# Altium schematic sheet Inputs_Outputs.SchDoc
size A4; Date: *******; ApprovedBy: *******; CheckedBy: None; Author: *******; CompanyName: *******; DrawnBy: Name; Engineer: *******; Organization: *******; Address1: *******; Address2: *******; Address3: *******; Address4: *******; DocumentNumber: Doc Num; Revision: *******; SheetNumber: 2; SheetTotal: 7; CurrentTime: *******; CurrentDate: *******; Time: *******; DocumentFullPathAndName: *******; DocumentName: *******; ModifiedDate: *******; ImagePath: *******; ProjectName: *******; Application_BuildNumber: *******
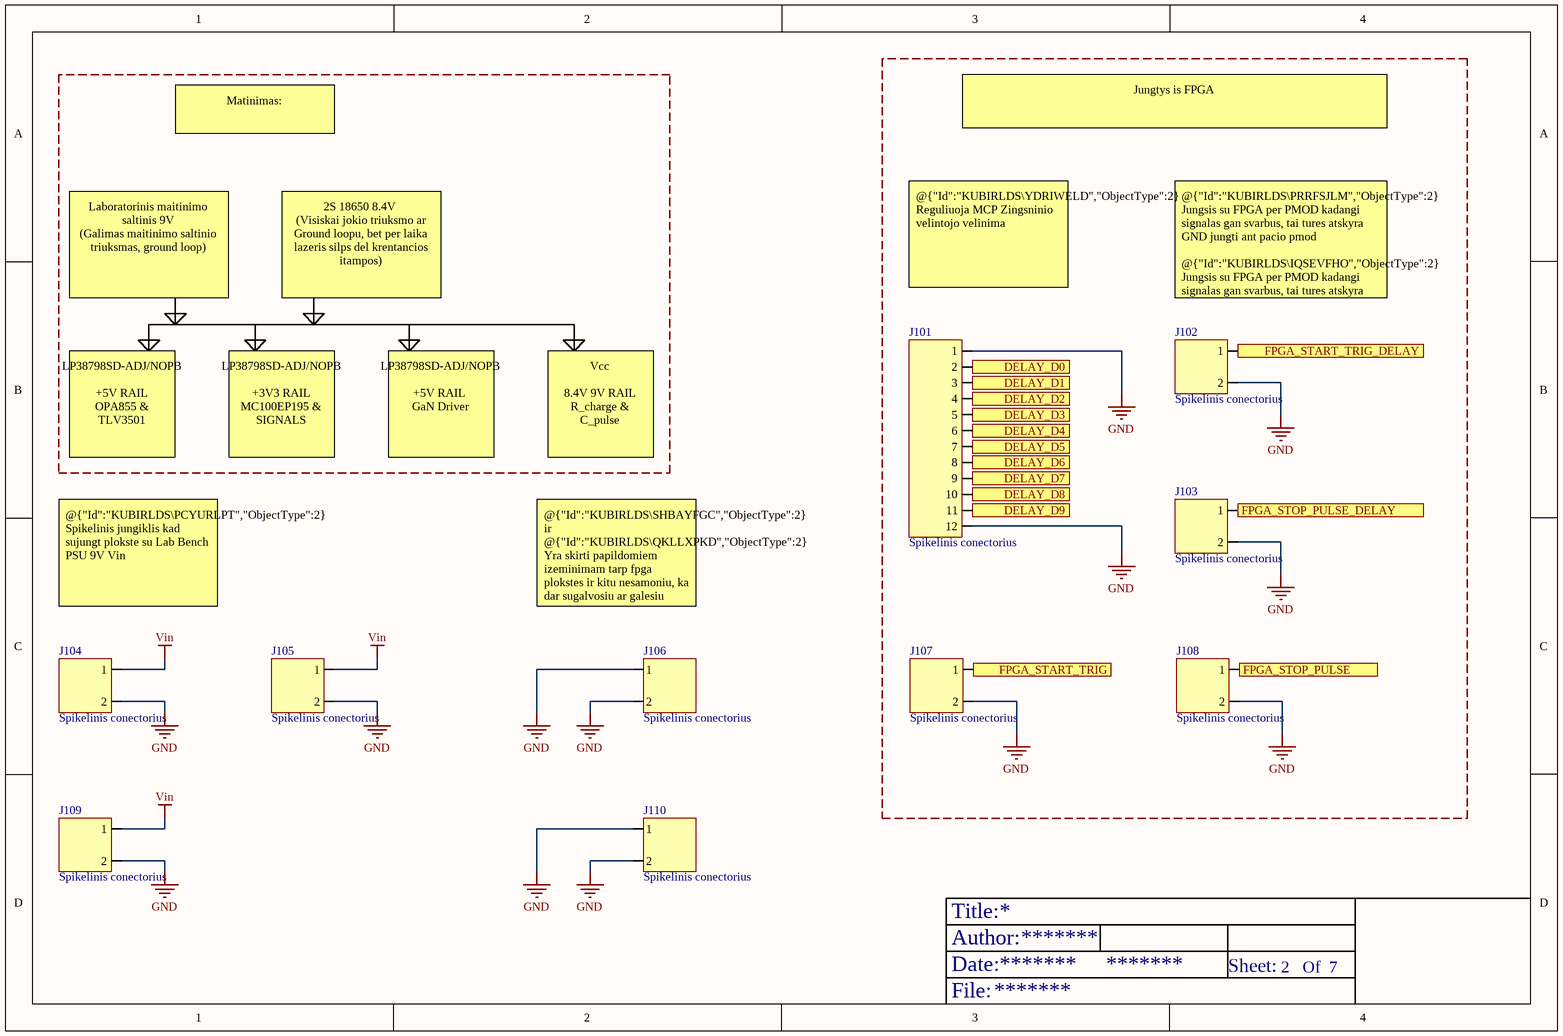
[diagram p0: Inputs_Outputs.SchDoc]

## Parts
J101  Spikelinis conectorius  [12pin header strip]
J102  Spikelinis conectorius  [2Pin header strip]
J103  Spikelinis conectorius  [2Pin header strip]
J104  Spikelinis conectorius  [2Pin header strip]
J105  Spikelinis conectorius  [2Pin header strip]
J106  Spikelinis conectorius  [2Pin header strip]
J107  Spikelinis conectorius  [2Pin header strip]
J108  Spikelinis conectorius  [2Pin header strip]
J109  Spikelinis conectorius  [2Pin header strip]
J110  Spikelinis conectorius  [2Pin header strip]

## Ports
DELAY_D0 (see Time_Delay[2B]), DELAY_D1 (see Time_Delay[2B]), DELAY_D2 (see Time_Delay[2B]), DELAY_D3 (see Time_Delay[2C]), DELAY_D4 (see Time_Delay[2C]), DELAY_D5 (see Time_Delay[2C]), DELAY_D6 (see Time_Delay[2C]), DELAY_D7 (see Time_Delay[2C]), DELAY_D8 (see Time_Delay[2C]), DELAY_D9 (see Time_Delay[2C]), FPGA_START_TRIG (see Laser_Driver[1C]), FPGA_START_TRIG_DELAY (see Time_Delay[1B]), FPGA_STOP_PULSE (see Light_Detection[4C]), FPGA_STOP_PULSE_DELAY (see Light_Detection[4B])

## Nets
GND: J101.1 J101.12 J102.2 J103.2 J104.2 J105.2 J106.1 J106.2 J107.2 J108.2 J109.2 J110.1 J110.2
Vin: J104.1 J105.1 J109.1
DELAY_D0: J101.2 ; port DELAY_D0
DELAY_D1: J101.3 ; port DELAY_D1
DELAY_D2: J101.4 ; port DELAY_D2
DELAY_D3: J101.5 ; port DELAY_D3
DELAY_D4: J101.6 ; port DELAY_D4
DELAY_D5: J101.7 ; port DELAY_D5
DELAY_D6: J101.8 ; port DELAY_D6
DELAY_D7: J101.9 ; port DELAY_D7
DELAY_D8: J101.10 ; port DELAY_D8
DELAY_D9: J101.11 ; port DELAY_D9
FPGA_START_TRIG: J107.1 ; port FPGA_START_TRIG
FPGA_START_TRIG_DELAY: J102.1 ; port FPGA_START_TRIG_DELAY
FPGA_STOP_PULSE: J108.1 ; port FPGA_STOP_PULSE
FPGA_STOP_PULSE_DELAY: J103.1 ; port FPGA_STOP_PULSE_DELAY

## Notes on the sheet
- Matinimas:
- Jungtys is FPGA
- Laboratorinis maitinimo saltinis 9V
  (Galimas maitinimo saltinio triuksmas, ground loop)
- 2S 18650 8.4V
  (Visiskai jokio triuksmo ar Ground loopu, bet per laika lazeris silps del krentancios itampos)
- @{"Id":"KUBIRLDS\YDRIWELD","ObjectType":2} Reguliuoja MCP Zingsninio velintojo velinima
- (near J102) @{"Id":"KUBIRLDS\PRRFSJLM","ObjectType":2} Jungsis su FPGA per PMOD kadangi signalas gan svarbus, tai tures atskyra GND jungti ant pacio pmod
  @{"Id":"KUBIRLDS\IQSEVFHO","ObjectType":2} Jungsis su FPGA per PMOD kadangi signalas gan svarbus, tai tures atskyra GND jungti ant pacio pmod
- LP38798SD-ADJ/NOPB
  +5V RAIL OPA855 & TLV3501
- LP38798SD-ADJ/NOPB
  +3V3 RAIL MC100EP195 & SIGNALS
- LP38798SD-ADJ/NOPB
  +5V RAIL
  GaN Driver
- Vcc
  8.4V 9V RAIL
  R_charge & C_pulse
- @{"Id":"KUBIRLDS\PCYURLPT","ObjectType":2} Spikelinis jungiklis kad sujungt plokste su Lab Bench PSU 9V Vin
- @{"Id":"KUBIRLDS\SHBAYFGC","ObjectType":2} ir @{"Id":"KUBIRLDS\QKLLXPKD","ObjectType":2} Yra skirti papildomiem izeminimam tarp fpga plokstes ir kitu nesamoniu, ka dar sugalvosiu ar galesiu izemint
- Title:
- Date:
- Author:
- Sheet:
- Of
- File:

## Library data of the parts
J101 = 12PinConnector: TSW-112-07-G-S
J102-J110 = 2PinConnector